# Altium schematic sheet voltage_regulators_boost.SchDoc
size A4; SheetNumber: 4; SheetTotal: 5
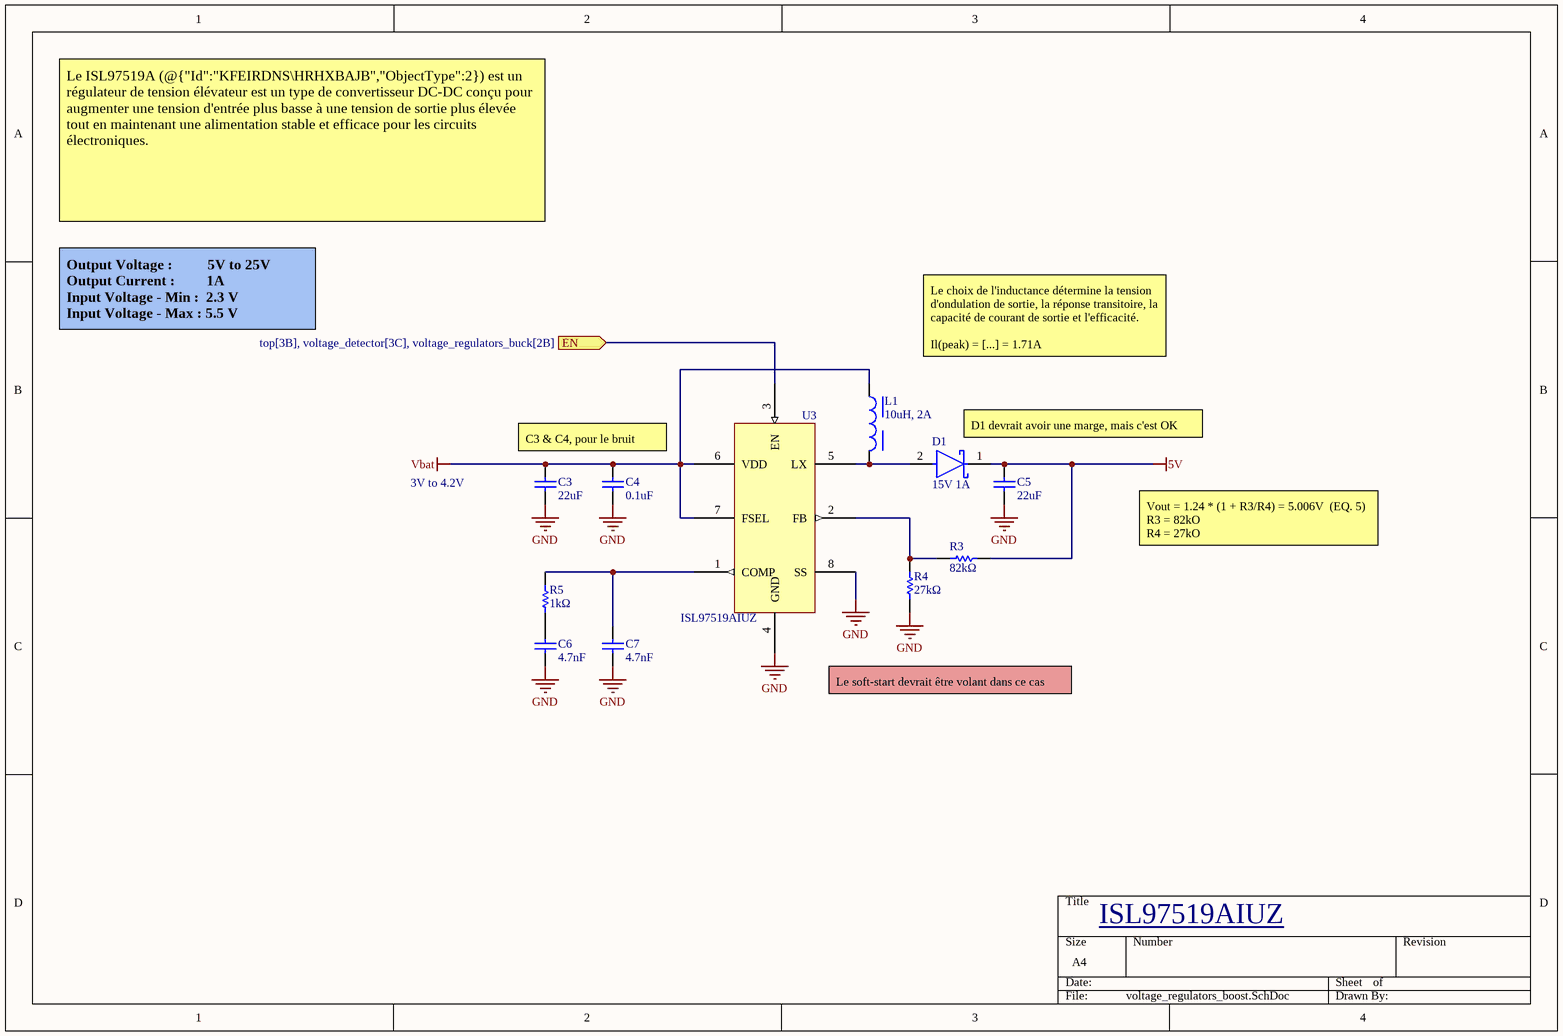
[diagram p0: voltage_regulators_boost.SchDoc]

## Parts
C3  22uF  [CAPC1608X90X35ML10T15]
C4  0.1uF  [CAPC1608X90X35LL15T15]
C5  22uF  [CAPC1608X90X35ML10T15]
C6  4.7nF  [CAPC1608X90X35ML10T15]
C7  4.7nF  [CAPC1608X90X35ML10T15]
D1  15V 1A  [FP-DO-214BA-IPC_C]
L1  10uH, 2A  [WE-MAIA_3015]
R3  82kΩ  [RESC1608X55X25LL10T15]
R4  27kΩ  [RESC1608X55X25LL10T15]
R5  1kΩ  [RESC1609X50X30LL10T20]
U3  ISL97519AIUZ  [ISL97519AIUZ]

## Ports
EN (in, see top[3B], voltage_detector[3C], voltage_regulators_buck[2B])

## Nets
5V: C5.2 D1.1(C) R3.1
GND: C3.1 C4.1 C5.1 C6.1 C7.1 R4.2 U3.4(GND) U3.8(SS)
Vbat: C3.2 C4.2 L1.1 U3.6(VDD) U3.7(FSEL)
EN: U3.3(EN) ; port EN
NetC6_2: C6.2 R5.1
NetC7_2: C7.2 R5.2 U3.1(COMP)
NetD1_2: D1.2(A) L1.2 U3.5(LX)
NetR3_2: R3.2 R4.1 U3.2(FB)

## Notes on the sheet
- Le ISL97519A (@{"Id":"KFEIRDNS\HRHXBAJB","ObjectType":2}) est un régulateur de tension élévateur est un type de convertisseur DC-DC conçu pour augmenter une tension d'entrée plus basse à une tension de sortie plus élevée tout en maintenant une alimentation stable et efficace pour les circuits électroniques.
- Output Voltage :          5V to 25V
  Output Current :         1A
  Input Voltage - Min :  2.3 V
  Input Voltage - Max : 5.5 V
- Le choix de l'inductance détermine la tension d'ondulation de sortie, la réponse transitoire, la capacité de courant de sortie et l'efficacité.
  Il(peak) = [...] = 1.71A
- C3 & C4, pour le bruit
- D1 devrait avoir une marge, mais c'est OK
- 3V to 4.2V
- Vout = 1.24 * (1 + R3/R4) = 5.006V  (EQ. 5)
  R3 = 82kO
  R4 = 27kO
- Le soft-start devrait être volant dans ce cas
- ISL97519AIUZ <https://www.mouser.ch/ProductDetail/Renesas-Intersil/ISL97519AIUZ?qs=sGAEpiMZZMvAX9OfPh%252B2NdrUzpYIC9WFoHZg1f2cJ9g%3D>

## Library data of the parts
C3 C5 = CMP-2006-02789-1: Part Number: GRM188R60G226MEA0L; Manufacturer: Murata
C4 = CMP-2006-02168-1: Manufacturer: AVX Interconnect / Elco; Part Number: LD035C104KAB2A
C6 C7 = CMP-2006-02924-1: Part Number: GRM188R71H472KA01D; Manufacturer: Murata
D1 = CMP-2000-06604-2: LSM115JE3/TR13 DIODE SCHOTTKY 15V 1A DO214BA; Manufacturer: Microsemi; Capacitance: 150pF; Peak Reverse Current: 10mA; Value: 150pF; Max Junction Temp: +100°C; Standoff Height: 0.01mm; Max Surge Forward Current: 50A; Device Class L2: Diodes; Automotive: No; Forward Current: 1A; ComponentLink2URL: https://media.digikey.com/pdf/Data%20Sheets/Microsemi%20PDFs/LSM115J.pdf; Max Repetitive Reverse Voltage: 15V; Mouser Description: Schottky Diodes & Rectifiers Schottky Rectifier; Device Class L3: Rectifier Diodes; Footprint Url: https://www.microsemi.com/packaging-information/partpackage/details?pid=5147; Octopart: https://octopart.com/lsm115je3%2Ftr13-microsemi-17743343; Category: Diode; Height: 2.92mm; RoHS: TRUE; Device Class L1: Discrete Semiconductors; Manufacturer Part Number: LSM115JE3/TR13; Lead Free: Yes; Temperature Range High: +100°C; ComponentLink2Description: Datasheet; Package: DO-214BA; Digikey Description: DIODE SCHOTTKY 15V 1A DO214BA; Temperature Range Low: -55°C; Temperature: -55°C to +100°C; Reverse Voltage: 15V
L1 = CMP-03913-56466825-2: 78438335100 Inductor, Aec-Q200, 10Uh, Shielded/0.85A Rohs Compliant: Yes; Core Material: Ferrite; Tolerance: 30%; Current Rating: 850mA; Test Frequency: 100kHz; DC Resistance (DCR): 446mΩ; Self Resonant Frequency: 21MHz; Inductance: 10µH; Width: 3mm; Ambient Temperature Range High: 85°C; Ambient Temperature Range Low: -40°C; Composition: Wirewound; Height: 1.5mm; Mount: Surface Mount; Saturation Current: 2A; NexarPartId: 56466825; Length: 3mm; Number of Pins: 2; Shielding: Shielded; Min Operating Temperature: -40°C; Height - Seated (Max): 1.4986mm; Case/Package: 1212; Ratings: AEC-Q200; Case Code (Imperial): 1212; Max Operating Temperature: 125°C; RoHS: Compliant; Case Code (Metric): 3030
R3 = CMP-2000-06947-1: Chip Resistor, 82 KOhm, +/- 1%, 0.1 W, -55 to 155 degC, 0603 (1608 Metric), RoHS, Tape and Reel; Manufacturer: Yageo; Temperature Coefficient: 100PPM/C; Unit Weight: 0.000071oz; Voltage Rating: 75V; Resistance: 82kOhms; Power Rating: 100mW; Packaging: Reel; Package Description: 2-Pin Surface Mount Device, Body 1.6 x 0.8 mm; Package / Case: 0603(1608metric); Series: RC; Operating Temperature Range: -55Cto+155C; Brand: Yageo; Case Code - in: 0603; Width: 0.8mm; Height: 0.45mm; Product Category: ThickFilmResistors; Length: 1.6mm; Product: ThickFilmResistorsGeneralPurpose; Manufacturer URL: http://www.yageo.com/; Datasheet URL: http://www.yageo.com/documents/recent/PYu-RC_Group_51_RoHS_L_7.pdf; RoHS: True; Datasheet Version: Rev. 7, 05/2017; Tolerance: 1%; Case Code - mm: 1608; Package Reference: 0603; Mounting Technology: SurfaceMount; Type: GeneralPurposeChipResistorSurfaceMount; Termination Style: SMD/SMT
R4 = CMP-2000-06933-1: Chip Resistor, 27 KOhm, +/- 1%, 0.1 W, -55 to 155 degC, 0603 (1608 Metric), RoHS, Tape and Reel; Manufacturer: Yageo; Resistance: 27kOhms; Temperature Coefficient: 100PPM/C; Power Rating: 100mW; Voltage Rating: 50V; Mounting Technology: SurfaceMount; Operating Temperature Range: -55Cto+155C; Case Code - in: 0603; Product: ThickFilmResistorsGeneralPurpose; Package Reference: 0603; Datasheet Version: Rev. 7, 05/2017; Tolerance: 1%; Manufacturer URL: http://www.yageo.com/; Termination Style: SMD/SMT; Packaging: Reel; Series: RC; Package Description: 2-Pin Surface Mount Device, Body 1.6 x 0.8 mm; Datasheet URL: http://www.yageo.com/documents/recent/PYu-RC_Group_51_RoHS_L_7.pdf; Case Code - mm: 1608
R5 = CMP-2000-02972-1: Manufacturer: Vishay Dale; Part Number: CRCW06031K00FKEC